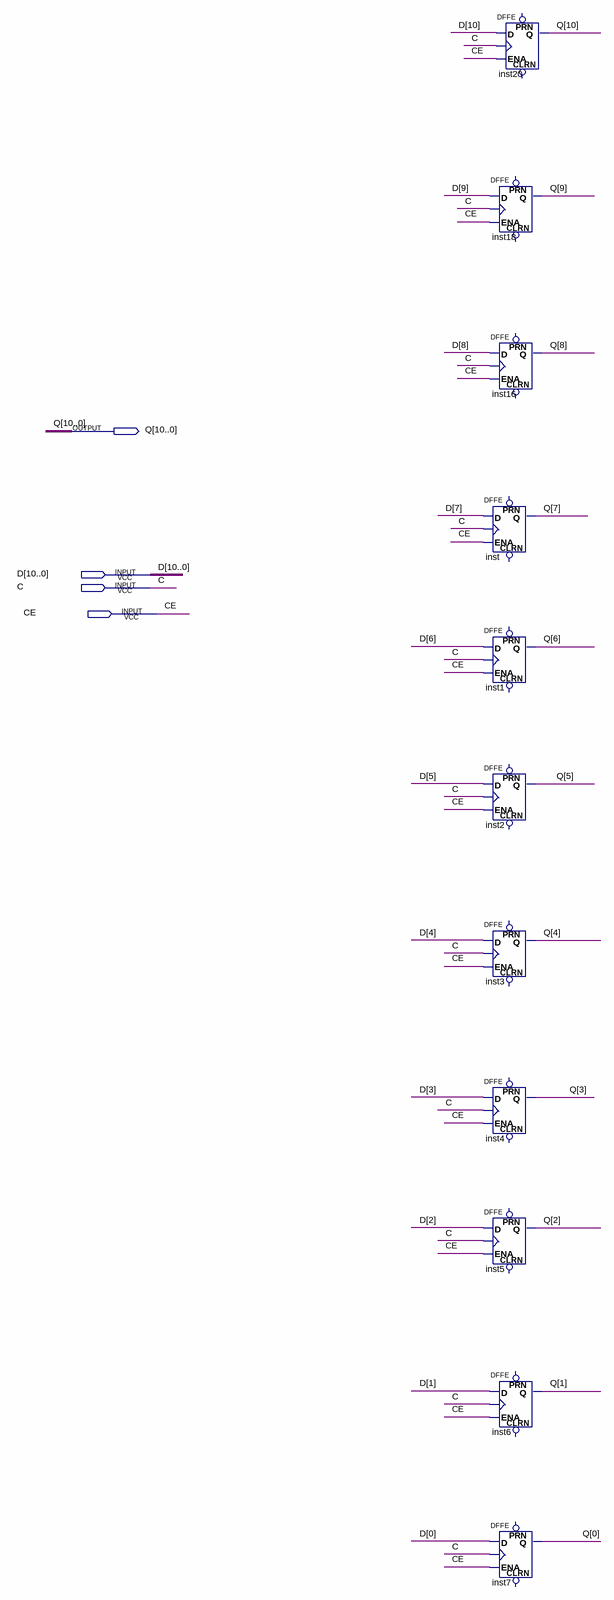
[diagram p0: schematic sheet]
// Quartus schematic REG11.bdf as structural Verilog: 11 symbols, 4 pins
module REG11 (
  input  [10:0] D,
  input  C,
  input  CE,
  output [10:0] Q
);

  DFFE inst20 (.D(D[10]), .CLK(C), .ENA(CE), .Q(Q[10]));  // open: PRN, CLRN
  DFFE inst18 (.D(D[9]), .CLK(C), .ENA(CE), .Q(Q[9]));  // open: PRN, CLRN
  DFFE inst16 (.D(D[8]), .CLK(C), .ENA(CE), .Q(Q[8]));  // open: PRN, CLRN
  DFFE inst (.D(D[7]), .CLK(C), .ENA(CE), .Q(Q[7]));  // open: PRN, CLRN
  DFFE inst1 (.D(D[6]), .CLK(C), .ENA(CE), .Q(Q[6]));  // open: PRN, CLRN
  DFFE inst2 (.D(D[5]), .CLK(C), .ENA(CE), .Q(Q[5]));  // open: PRN, CLRN
  DFFE inst3 (.D(D[4]), .CLK(C), .ENA(CE), .Q(Q[4]));  // open: PRN, CLRN
  DFFE inst4 (.D(D[3]), .CLK(C), .ENA(CE), .Q(Q[3]));  // open: PRN, CLRN
  DFFE inst5 (.D(D[2]), .CLK(C), .ENA(CE), .Q(Q[2]));  // open: PRN, CLRN
  DFFE inst6 (.D(D[1]), .CLK(C), .ENA(CE), .Q(Q[1]));  // open: PRN, CLRN
  DFFE inst7 (.D(D[0]), .CLK(C), .ENA(CE), .Q(Q[0]));  // open: PRN, CLRN
endmodule
